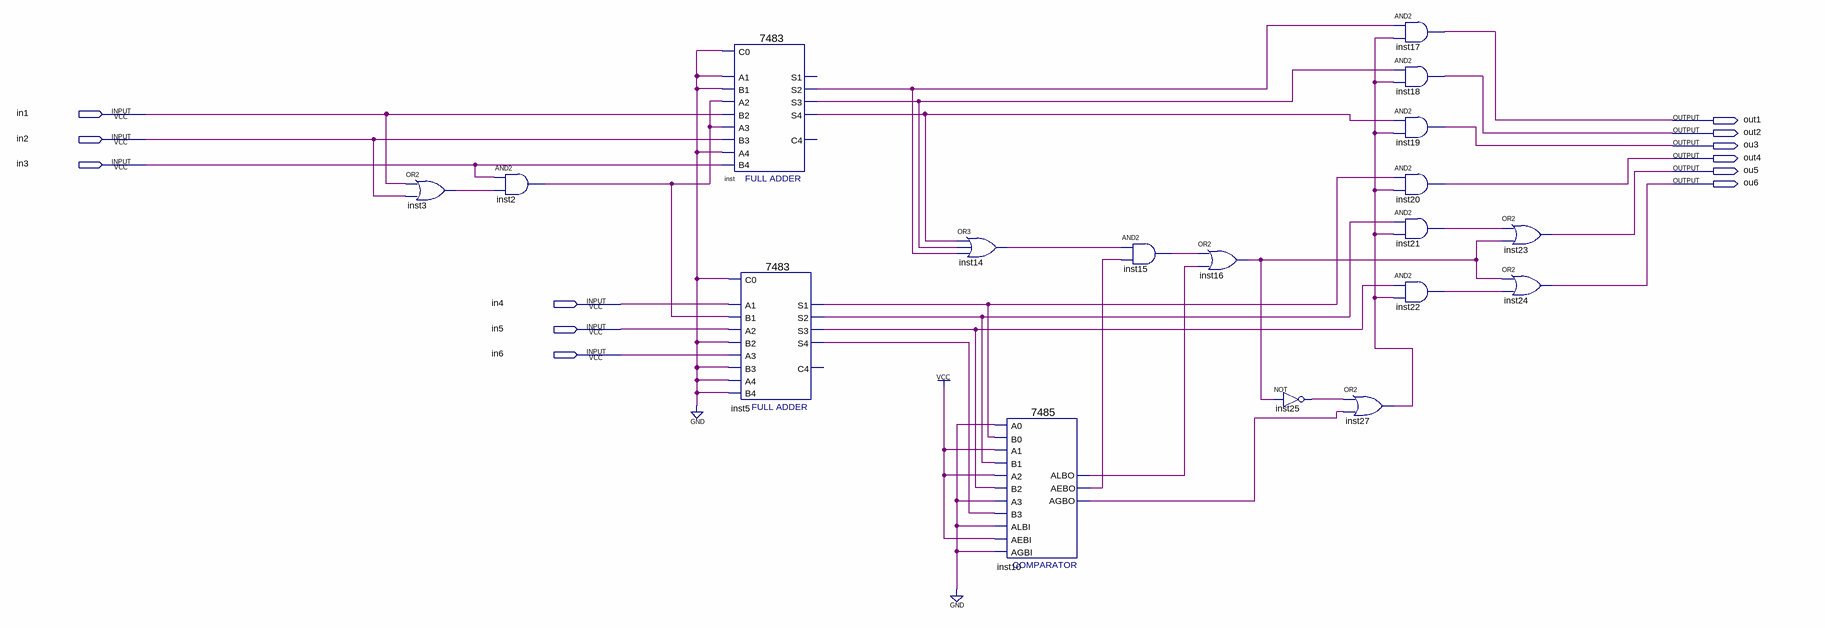
[diagram p0: schematic sheet]
// Quartus schematic timerBlock.bdf as structural Verilog: 18 symbols, 12 pins
module timerBlock (
  input  in1,
  input  in2,
  input  in3,
  input  in4,
  input  in5,
  input  in6,
  output out1,
  output out2,
  output ou3,
  output out4,
  output ou5,
  output ou6
);

  wire inst2_out, inst3_out, inst5_s1, inst5_s2, inst5_s3, inst5_s4, inst10_aebo, inst10_agbo, inst10_albo,
       inst14_out, inst15_out, inst16_out, inst21_out, inst22_out, inst25_out, inst27_out, inst_s2, inst_s3,
       inst_s4;

  or inst3 (inst3_out, in1, in2);
  and inst2 (inst2_out, in3, inst3_out);
  \7483  inst (
    .B4(in3), .C0(1'b0), .A1(1'b0), .A2(inst2_out), .B1(1'b0), .B2(in1), .A3(inst2_out), .B3(in2), .A4(1'b0),
    .S3(inst_s3), .S4(inst_s4), .S2(inst_s2));  // open: C4, S1
  \7483  inst5 (
    .B4(1'b0), .C0(1'b0), .A1(in4), .A2(in5), .B1(inst2_out), .B2(1'b0), .A3(in6), .B3(1'b0), .A4(1'b0),
    .S3(inst5_s3), .S4(inst5_s4), .S2(inst5_s2), .S1(inst5_s1));  // open: C4
  or inst14 (inst14_out, inst_s4, inst_s3, inst_s2);
  \7485  inst10 (
    .A3(1'b0), .B2(inst5_s3), .A2(1'b1), .AEBI(1'b1), .AGBI(1'b0), .ALBI(1'b0), .A0(1'b0), .B0(inst5_s1),
    .B3(inst5_s4), .A1(1'b1), .B1(inst5_s2), .ALBO(inst10_albo), .AGBO(inst10_agbo), .AEBO(inst10_aebo));
  and inst15 (inst15_out, inst14_out, inst10_aebo);
  or inst16 (inst16_out, inst15_out, inst10_albo);
  not inst25 (inst25_out, inst16_out);
  or inst27 (inst27_out, inst25_out, inst10_agbo);
  and inst17 (out1, inst_s2, inst27_out);
  and inst18 (out2, inst_s3, inst27_out);
  and inst19 (ou3, inst_s4, inst27_out);
  and inst20 (out4, inst5_s1, inst27_out);
  and inst21 (inst21_out, inst5_s2, inst27_out);
  and inst22 (inst22_out, inst5_s3, inst27_out);
  or inst23 (ou5, inst21_out, inst16_out);
  or inst24 (ou6, inst16_out, inst22_out);
endmodule
